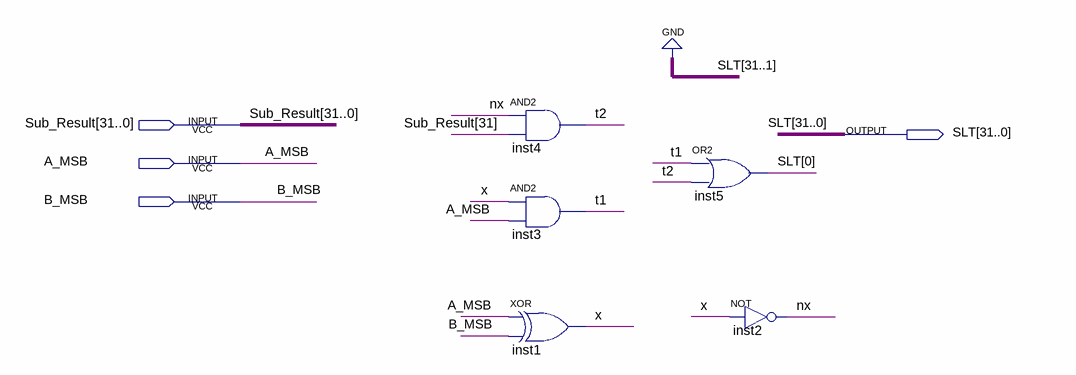
[diagram p0: schematic sheet]
// Quartus schematic SLT_32bit.bdf as structural Verilog: 5 symbols, 4 pins
module SLT_32bit (
  input  [31:0] Sub_Result,
  input  A_MSB,
  input  B_MSB,
  output [31:0] SLT
);

  wire nx, t1, t2, x;

  and inst4 (t2, nx, Sub_Result[31]);
  and inst3 (t1, x, A_MSB);
  xor inst1 (x, A_MSB, B_MSB);
  or inst5 (SLT[0], t1, t2);
  not inst2 (nx, x);

  assign SLT[31:1] = {31{1'b0}};
endmodule
